# Altium schematic sheet PLL.SchDoc
size 297 x 209 mm
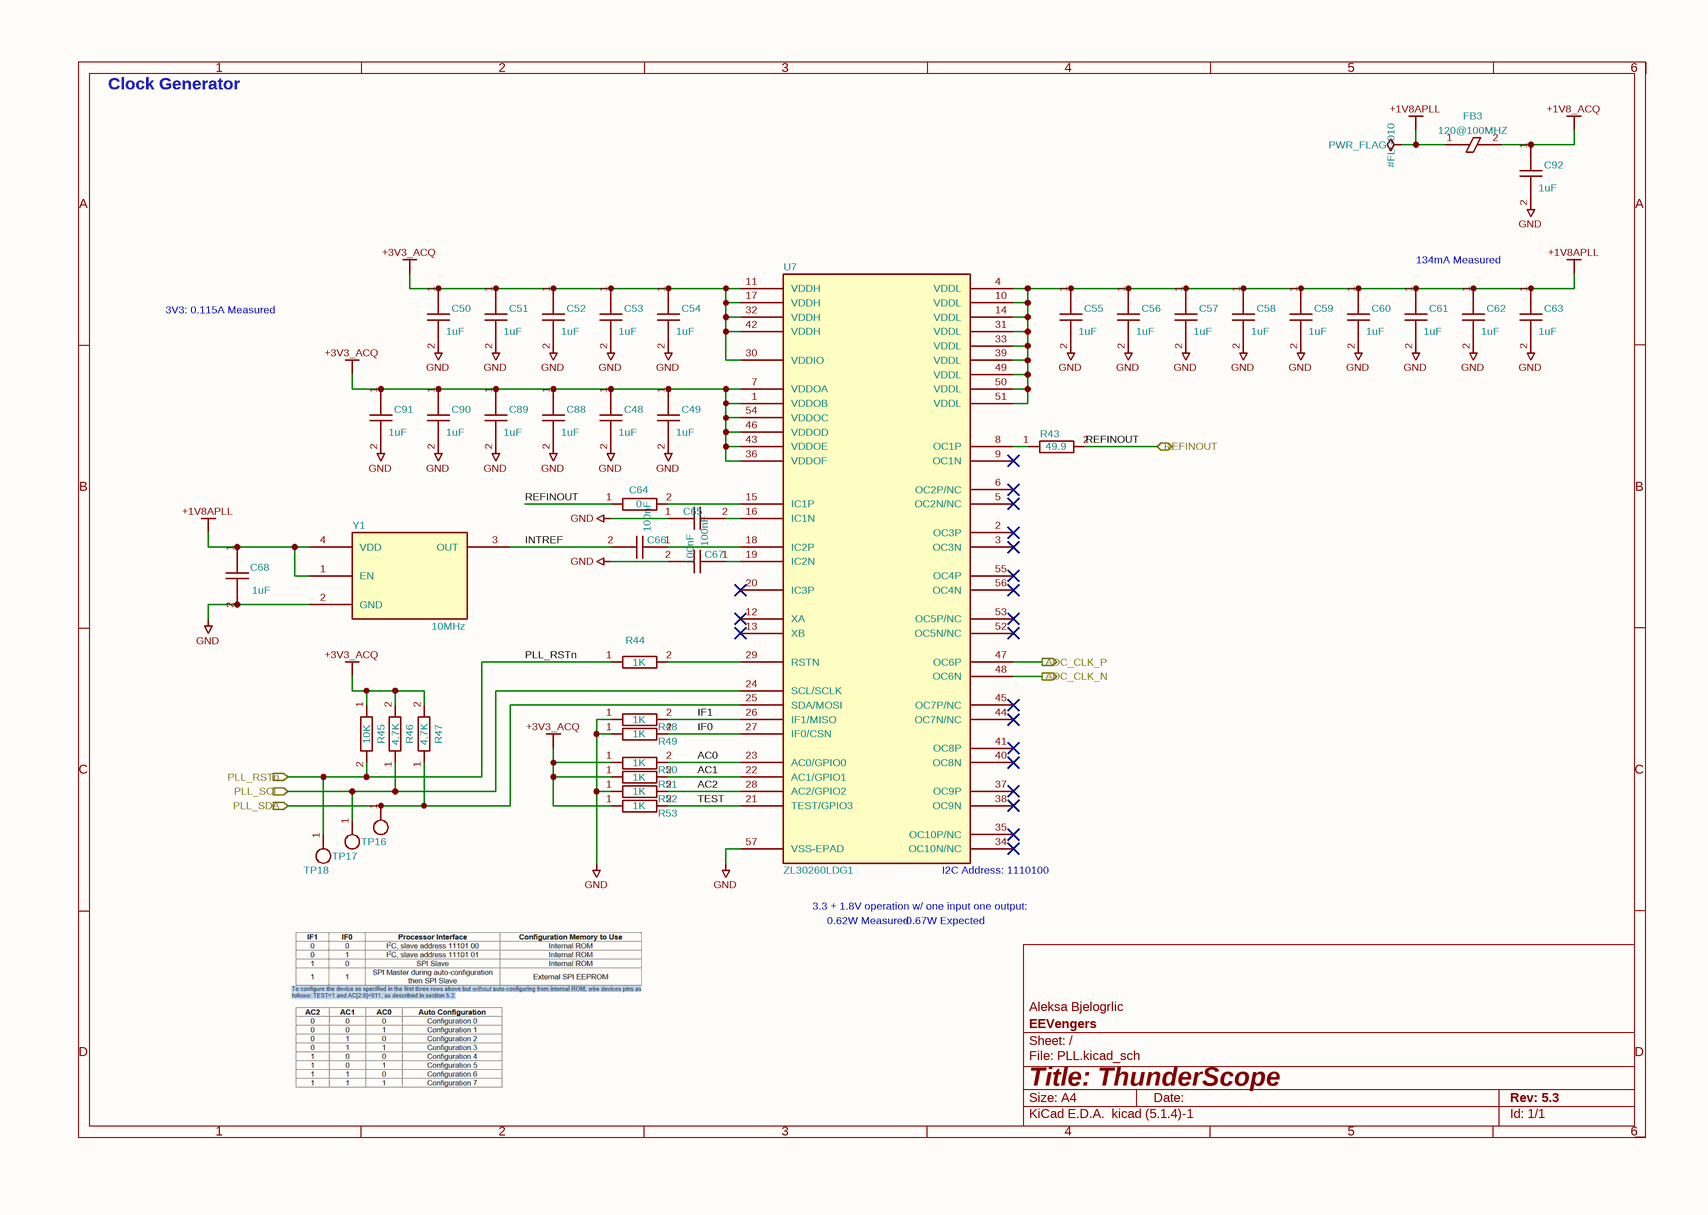
[diagram p0: PLL.SchDoc]

## Parts
#FLG010  PWR_FLAG  (graphical)
C48  1uF  [GEN_C_0402]
C49  1uF  [GEN_C_0402]
C50  1uF  [GEN_C_0402]
C51  1uF  [GEN_C_0402]
C52  1uF  [GEN_C_0402]
C53  1uF  [GEN_C_0402]
C54  1uF  [GEN_C_0402]
C55  1uF  [GEN_C_0402]
C56  1uF  [GEN_C_0402]
C57  1uF  [GEN_C_0402]
C58  1uF  [GEN_C_0402]
C59  1uF  [GEN_C_0402]
C60  1uF  [GEN_C_0402]
C61  1uF  [GEN_C_0402]
C62  1uF  [GEN_C_0402]
C63  1uF  [GEN_C_0402]
C64  0  [GEN_R_0402]
C65  100nF  [GEN_C_0402]
C66  100nF  [GEN_C_0402]
C67  100nF  [GEN_C_0402]
C68  1uF  [GEN_C_0402]
C88  1uF  [GEN_C_0402]
C89  1uF  [GEN_C_0402]
C90  1uF  [GEN_C_0402]
C91  1uF  [GEN_C_0402]
C92  1uF  [GEN_C_0402]
FB3  120@100MHZ  [GEN_R_0402]
R43  49.9  [GEN_R_0402]
R44  1K  [GEN_R_0402]
R45  10K  [GEN_R_0402]
R46  4.7K  [GEN_R_0402]
R47  4.7K  [GEN_R_0402]
R48  1K  [GEN_R_0402]
R49  1K  [GEN_R_0402]
R50  1K  [GEN_R_0402]
R51  1K  [GEN_R_0402]
R52  1K  [GEN_R_0402]
R53  1K  [GEN_R_0402]
TP16  PCB  [GEN_TP_PCB]  (value not drawn)
TP17  PCB  [GEN_TP_PCB]  (value not drawn)
TP18  PCB  [GEN_TP_PCB]  (value not drawn)
U7  ZL30260LDG1  [MC_QFN56_ZL30260]
Y1  10MHz  [ECS_TXO-3225]

## Ports
ADC_CLK_N (out), ADC_CLK_P (out), PLL_RSTn (in), PLL_SCL (in), PLL_SDA (in), REFINOUT (bidir)

## Nets
+1V8_ACQ: C92.1 FB3.2
+1V8APLL: #FLG010.1 C55.1 C56.1 C57.1 C58.1 C59.1 C60.1 C61.1 C62.1 C63.1 C68.1 FB3.1 U7.4(VDDL) U7.10(VDDL) U7.14(VDDL) U7.31(VDDL) U7.33(VDDL) U7.39(VDDL) U7.49(VDDL) U7.50(VDDL) U7.51(VDDL) Y1.1(EN) Y1.4(VDD)
+3V3_ACQ: C48.1 C49.1 C50.1 C51.1 C52.1 C53.1 C54.1 C88.1 C89.1 C90.1 C91.1 R45.1 R46.2 R47.2 R50.1 R51.1 R53.1 U7.1(VDDOB) U7.7(VDDOA) U7.11(VDDH) U7.17(VDDH) U7.30(VDDIO) U7.32(VDDH) U7.36(VDDOF) U7.42(VDDH) U7.43(VDDOE) U7.46(VDDOD) U7.54(VDDOC)
GND: C48.2 C49.2 C50.2 C51.2 C52.2 C53.2 C54.2 C55.2 C56.2 C57.2 C58.2 C59.2 C60.2 C61.2 C62.2 C63.2 C65.1 C67.2 C68.2 C88.2 C89.2 C90.2 C91.2 C92.2 R48.1 R49.1 R52.1 U7.57(VSS-EPAD) Y1.2(GND)
AC0: R50.2 U7.23(AC0/GPIO0)
AC1: R51.2 U7.22(AC1/GPIO1)
AC2: R52.2 U7.28(AC2/GPIO2)
ADC_CLK_N: U7.48(OC6N) ; port ADC_CLK_N
ADC_CLK_P: U7.47(OC6P) ; port ADC_CLK_P
IF0: R49.2 U7.27(IF0/CSN)
IF1: R48.2 U7.26(IF1/MISO)
INTREF: C66.2 Y1.3(OUT)
PLL_RSTn: R44.1 R45.2 TP18.1 ; port PLL_RSTn
PLL_SCL: R46.1 TP17.1 U7.24(SCL/SCLK) ; port PLL_SCL
PLL_SDA: R47.1 TP16.1 U7.25(SDA/MOSI) ; port PLL_SDA
REFINOUT: C64.1 R43.2 ; port REFINOUT
TEST: R53.2 U7.21(TEST/GPIO3)
NetC64_2: C64.2 U7.15(IC1P)
NetC65_2: C65.2 U7.16(IC1N)
NetC66_1: C66.1 U7.18(IC2P)
NetC67_1: C67.1 U7.19(IC2N)
NetR43_1: R43.1 U7.8(OC1P)
NetR44_2: R44.2 U7.29(RSTN)

Not connected (* = marked no-connect by the designer): U7 2(OC3P)* 3(OC3N)* 5(OC2N/NC)* 6(OC2P/NC)* 9(OC1N)* 12(XA)* 13(XB)* 20(IC3P)* 34(OC10N/NC)* 35(OC10P/NC)* 37(OC9P)* 38(OC9N)* 40(OC8N)* 41(OC8P)* 44(OC7N/NC)* 45(OC7P/NC)* 52(OC5N/NC)* 53(OC5P/NC)* 55(OC4P)* 56(OC4N)*

## Notes on the sheet
- Clock Generator
- 134mA Measured
- 3V3: 0.115A Measured
- (near U7) 3.3 + 1.8V operation w/ one input one output:
- 0.62W Measured
- 0.67W Expected
- (near U7) I2C Address: 1110100
- 1
- 2
- 3
- 4
- 5
- 6
- A
- B
- C
- Aleksa Bjelogrlic
- D
- Title: ThunderScope
- File: PLL.kicad_sch
- Sheet: /
- EEVengers
- KiCad E.D.A.  kicad (5.1.4)-1
- Size: A4
- Date:
- Rev: 5.3
- Id: 1/1

## Library data of the parts
C48-C63 C68 C88-C92 = CAP 1uF 25V X5R 0402: MANUFACTURER: Murata; MANUFACTURER PART NUMBER: GRM155R61E105KA12D; VOLTAGE RATING: 25V; Substitutions Policy: Any Parametric Equivalent; PACKAGE: 0402; SUPPLIER 1: Mouser; SUPPLIER PART NUMBER 1: 81-GRM155R61E105KA2D; Footprint: Thunderscope_Rev5:GEN_C_0402; Value: 1uF
C64 = RES 0 OHM 1/16W 0402: MANUFACTURER: Yageo; MANUFACTURER PART NUMBER: RC0402JR-070RL; Substitutions Policy: Any Parametric Equivalent; PACKAGE: 0402; SUPPLIER 1: Mouser; SUPPLIER PART NUMBER 1: 603-RC0402JR-070RL; Footprint: Thunderscope_Rev5:GEN_R_0402; Value: 0
C65-C67 = CAP 100nF 16V X7R 0402: HOUSE PART NUMBER: C-100nF-0402-002; MANUFACTURER: Murata; MANUFACTURER PART NUMBER: GCM155R71C104KA55D; VOLTAGE RATING: 16V; Substitutions Policy: Any Parametric Equivalent; PACKAGE: 0402; SUPPLIER 1: Mouser; SUPPLIER PART NUMBER 1: 81-GCM155R71C104KA5D; Footprint: Thunderscope_Rev5:GEN_C_0402; Value: 100nF
FB3 = FERRITE BEAD 120 OHM 0402: HOUSE PART NUMBER: BLM15PX121SN1D; MANUFACTURER: Murata; Substitutions Policy: No Substitutions; SUPPLIER 1: Mouser; SUPPLIER PART NUMBER 1: 81-BLM15PX121SN1D; MANUFACTURER PART NUMBER: BLM15PX121SN1D; PACKAGE: 0402; Footprint: Thunderscope_Rev5:GEN_R_0402; Value: 120@100MHZ
R43 = RES 49.9 OHM 1% 1/10W 0402: MANUFACTURER: Yageo; MANUFACTURER PART NUMBER: RC0402FR-0749R9L; TOLERANCE: 1%; Substitutions Policy: Any Parametric Equivalent; PACKAGE: 0402; SUPPLIER 1: Mouser; SUPPLIER PART NUMBER 1: 603-RC0402FR-0749R9L; Footprint: Thunderscope_Rev5:GEN_R_0402; Value: 49.9
R44 R48-R53 = RES 1K OHM 1% 1/10W 0402: HOUSE PART NUMBER: R-1K-0402-1%-001; MANUFACTURER: Yageo; MANUFACTURER PART NUMBER: RC0402FR-071KL; TOLERANCE: 1%; Substitutions Policy: Any Parametric Equivalent; PACKAGE: 0402; SUPPLIER 1: Mouser; SUPPLIER PART NUMBER 1: 603-RC0402FR-071KL; Footprint: Thunderscope_Rev5:GEN_R_0402; Value: 1K
R45 = RES 10K OHM 1% 1/16W 0402: MANUFACTURER: Yageo; MANUFACTURER PART NUMBER: RC0402FR-0710KL; TOLERANCE: 1%; Substitutions Policy: Any Parametric Equivalent; PACKAGE: 0402; SUPPLIER 1: Mouser; SUPPLIER PART NUMBER 1: 603-RC0402FR-0710KL; Footprint: Thunderscope_Rev5:GEN_R_0402; Value: 10K
R46 R47 = RES 4.7K OHM 1% 1/16W 0402: MANUFACTURER: Yageo; MANUFACTURER PART NUMBER: RC0402FR-074K7L; TOLERANCE: 1%; Substitutions Policy: Any Parametric Equivalent; PACKAGE: 0402; SUPPLIER 1: Mouser; SUPPLIER PART NUMBER 1: 603-RC0402FR-074K7L; Footprint: Thunderscope_Rev5:GEN_R_0402; Value: 4.7K
TP16-TP18 = TP PCB 1mm: Footprint: Thunderscope_Rev5:GEN_TP_PCB; Value: PCB
U7 = IC CLK GEN ZL30260LDG1: MANUFACTURER: Microchip; Substitutions Policy: No Substitutions; MANUFACTURER PART NUMBER: ZL30260LDG1; SUPPLIER 1: Mouser; SUPPLIER PART NUMBER 1: 494-ZL30260LDG1; PACKAGE: 56-VFQFN (8x8mm); Value: ZL30260LDG1; Footprint: Thunderscope_Rev5:MC_QFN56_ZL30260
Y1 = OSC 10MHz ECS-TXO-3225MV: MANUFACTURER: ECS International; MANUFACTURER PART NUMBER: ECS-TXO-3225MV-100-TR; Substitutions Policy: ECO Required for Substitution; SUPPLIER 1: Mouser; SUPPLIER PART NUMBER 1: 520-TXO-3225MV-100-T; PACKAGE: 4-SMD (3.2x2.5mm); Value: 10MHz; Footprint: Thunderscope_Rev5:ECS_TXO-3225
#FLG010 = PWR_FLAG: Value: PWR_FLAG